# Altium schematic sheet MCU_Power_Sheet.SchDoc
size A4
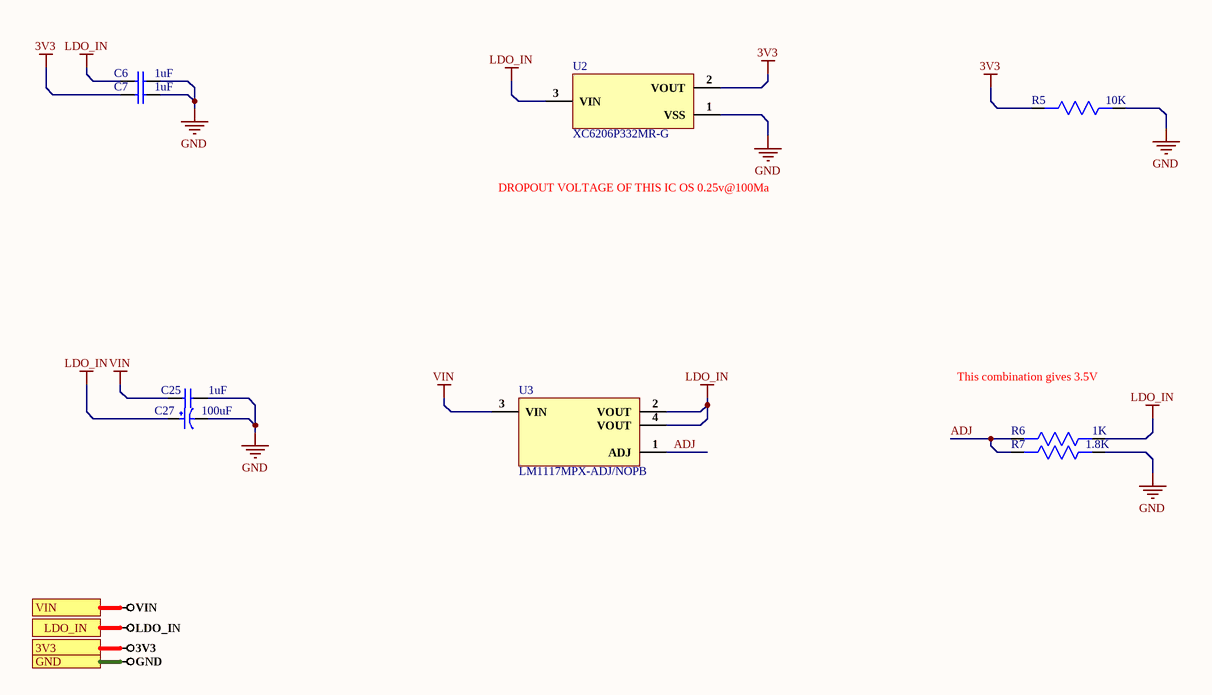
[diagram p0: MCU_Power_Sheet.SchDoc]

## Parts
C6  1uF  [Cap0603]
C7  1uF  [Cap0603]
C25  1uF  [Cap0603]
C27  100uF  [RVT1A101M0505]
R5  10K  [RES 0805]
R6  1K  [RES 0805]
R7  1.8K  [Res0603]
U2  XC6206P332MR-G  [sot-23]
U3  LM1117MPX-ADJ/NOPB  [SOT-223]

## Ports
3V3, GND, LDO_IN, VIN

## Nets
3V3: C7.1 R5.2 U2.2(VOUT) ; port 3V3
GND: C6.2 C7.2 C25.2 C27.2 R5.1 R7.1 U2.1(VSS) ; port GND
LDO_IN: C6.1 C27.1 R6.1 U2.3(VIN) U3.2(VOUT) U3.4(VOUT) ; port LDO_IN
VIN: C25.1 U3.3(VIN) ; port VIN
ADJ: R6.2 R7.2 U3.1(ADJ)

## Notes on the sheet
- DROPOUT VOLTAGE OF THIS IC OS 0.25v@100Ma
- This combination gives 3.5V

## Library data of the parts
C6 C7 C25 = CC0603KRX5R8BB105: CAP CER 1UF 25V X5R 0603; Manufacturer: Yageo; Tolerance: 10%; Supplier 1: Digi-Key; Manufacturer Part Number: CC0603KRX5R8BB105; RoHS: Yes; Category: Ceramic Capacitors; Stock 1: 919939; Pricing 1: 1=0.12000, 10=0.08400, 50=0.04760, 100=0.03940, 500=0.02764, 1000=0.02288 (USD); Mount: Surface Mount; Case/Package: 0603; Number of Pins: 2; Case Code (Metric): 1608; Case Code (Imperial): 0603; Min Operating Temperature: -55°C; Max Operating Temperature: 85°C; Capacitance: 1uF; Dielectric: X5R; Package Quantity: 1; Voltage Rating: 25V; Packaging: Tape and Reel; Termination: SMD/SMT; Voltage Rating (DC): 25V; Series: CC; Construction: Flat; Length: 1.6mm; Width: 0.031inch; Height: 0.8mm; Thickness: 0.035inch; Depth: 0.8mm; Radiation Hardening: No; REACH SVHC: No SVHC; Lead Free: Lead Free; Halogen Free: Halogen Free; RoHS Compliant: Yes; ComponentLink1URL: https://datasheet.ciiva.com/176/mlccorderingcode-176785.pdf?src-supplier=Digi-Key; ComponentLink1Description: https://datasheet.ciiva.com/176/mlccorderingcode-176785.pdf?src-supplier=Digi-Key; ComponentLink2URL: https://datasheet.ciiva.com/176/mlccorderingcode-176786.pdf?src-supplier=Digi-Key; ComponentLink2Description: https://datasheet.ciiva.com/176/mlccorderingcode-176786.pdf?src-supplier=Digi-Key; ComponentLink3URL: https://datasheet.ciiva.com/176/mlccorderingcode-176787.pdf?src-supplier=Digi-Key; ComponentLink3Description: https://datasheet.ciiva.com/176/mlccorderingcode-176787.pdf?src-supplier=Digi-Key; ComponentLink4URL: https://datasheet.ciiva.com/17436/upy-gphc-x5r-4v-to-50v-12-17436952.pdf?src-supplier=Avnet+Europe; ComponentLink4Description: https://datasheet.ciiva.com/17436/upy-gphc-x5r-4v-to-50v-12-17436952.pdf?src-supplier=Avnet+Europe; ComponentLink5URL: https://datasheet.ciiva.com/7978/1525783-7978171.pdf?src-supplier=Element14; ComponentLink5Description: https://datasheet.ciiva.com/7978/1525783-7978171.pdf?src-supplier=Element14; ComponentLink6URL: https://datasheet.ciiva.com/11586/upy-gphc-x5r-4v-to-50v-12-11586318.pdf?src-supplier=Avnet; ComponentLink6Description: https://datasheet.ciiva.com/11586/upy-gphc-x5r-4v-to-50v-12-11586318.pdf?src-supplier=Avnet; Supplier Part Number 1: 311-1445-1-ND
C27 = RVT1A101M0505: 100uF ±20% 10V 5mm 5.4mm 2000hrs 105℃ -45℃~+105℃ SMD,5x5.4mm Aluminum Electrolytic Capacitors - SMD RoHS; Manufacturer: CX(Dongguan Chengxing Elec); Package: SMD,5x5.4mm; Capacitance: 100uF; Tolerance: ±20%; Rated Voltage: 10V; φD: 5mm; L: 5.4mm; Operating Temperature: -45℃~+105℃
R5 = RMCF0805FT10K0: RES 10K OHM 1% 1/8W 0805; Manufacturer: Stackpole Electronics; Resistance: 10kR; Power Rating: 125mW; Temperature Coefficient: 100ppm/°C; Supplier 1: Digi-Key; Manufacturer Part Number: RMCF0805FT10K0; RoHS: Yes; Category: Chip SMD Resistors; Stock 1: 308321; Pricing 1: 1=0.10000, 10=0.02700, 100=0.01090, 1000=0.00488, 2500=0.00423 (USD); Mount: Surface Mount; Case/Package: 0805; Case Code (Metric): 2012; Case Code (Imperial): 0805; Contact Plating: Tin,Matte; Size Code: 0805; Min Operating Temperature: -55°C; Max Operating Temperature: 155°C; Tolerance: 1%; Packaging: Tape and Reel; Resistor Type: Thick Film; Number of Terminations: 2; Max Power Dissipation: 125mW; Features: Automotive AEC-Q200; Series: RMCF; Construction: Rectangular; Length: 2mm; Width: 0.049inch; Height: 0.026inch; Depth: 1.25mm; Radiation Hardening: No; Lead Free: Lead Free; Military Standard: Not; RoHS Compliant: Yes; ComponentLink1URL: https://datasheet.ciiva.com/15193/getdatasheetpartid-362046-15193525.pdf?src-supplier=Verical; ComponentLink1Description: https://datasheet.ciiva.com/15193/getdatasheetpartid-362046-15193525.pdf?src-supplier=Verical; Supplier Part Number 1: RMCF0805FT10K0CT-ND
R6 = CRCW08051K00JNEB: RES SMD 1K OHM 5% 1/8W 0805; Manufacturer: Vishay Dale; Resistance: 1kR; Power Rating: 125mW; Voltage Rating: 150V; Temperature Coefficient: 200ppm/°C; Supplier 1: Digi-Key; Manufacturer Part Number: CRCW08051K00JNEB; RoHS: Yes; Category: Chip SMD Resistors; Stock 1: 4389; Pricing 1: 1=0.10000, 10=0.05000, 100=0.02040, 1000=0.00914, 2500=0.00794, 5000=0.00656 (USD); Case/Package: 0805; Number of Pins: 2; Weight: 0.000194oz; Case Code (Imperial): 0805; Case Code (Metric): 2012; Contact Plating: Tin; Min Operating Temperature: -55°C; Max Operating Temperature: 155°C; Packaging: Tape and Reel; Tolerance: 5%; Package Quantity: 10000; Resistor Type: Thick Film; Number of Terminations: 2; Termination: SMD/SMT; Max Power Dissipation: 125mW; Voltage Rating (DC): 150V; Features: Automotive AEC-Q200; Length: 0.079inch; Width: 0.049inch; Height: 0.02inch; Radiation Hardening: No; REACH SVHC: Unknown; Lead Free: Lead Free; ComponentLink1URL: https://datasheet.ciiva.com/5548/dcrcwe3-109170-5548326.pdf?src-supplier=Mouser; ComponentLink1Description: https://datasheet.ciiva.com/5548/dcrcwe3-109170-5548326.pdf?src-supplier=Mouser; ComponentLink2URL: https://datasheet.ciiva.com/28621/1747939-28621434.pdf?src-supplier=Element14; ComponentLink2Description: https://datasheet.ciiva.com/28621/1747939-28621434.pdf?src-supplier=Element14; Supplier Part Number 1: 541-CRCW08051K00JNEBCT-ND
R7 = RC0603FR-071K8L: Res Thick Film 0603 1.8K Ohm 1% 0.1W(1/10W) ±100ppm/C Molded SMD Paper T/R; Manufacturer: Yageo; Resistance: 1.8kR; Temperature Coefficient: 100ppm/°C; Voltage Rating (DC): 50V; Power Rating: 100mW; Supplier 1: Digi-Key; Manufacturer Part Number: RC0603FR-071K8L; RoHS: Yes; Category: Chip SMD Resistors; Stock 1: 827154; Pricing 1: 1=0.10000, 10=0.02400, 100=0.00970, 1000=0.00436, 2500=0.00378 (USD); Case/Package: 0603; Number of Pins: 2; Case Code (Metric): 1608; Case Code (Imperial): 0603; Size Code: 0603; Min Operating Temperature: -55°C; Max Operating Temperature: 155°C; Tolerance: 1%; Resistor Type: Thick Film; Packaging: Tape and Reel; Voltage Rating: 50V; Package Quantity: 5000; Number of Terminations: 2; Termination: SMD/SMT; Max Power Dissipation: 100mW; Features: Moisture Resistant; Series: RC; Resistance Tolerance: 1%; Technology: THICK FILM; Construction: Rectangular; Length: 1.6mm; Width: 0.8mm; Height: 0.45mm; Depth: 0.8mm; REACH SVHC: No SVHC; Lead Free: Lead Free; Military Standard: Not; RoHS Compliant: Yes; ComponentLink1URL: https://datasheet.ciiva.com/11808/0900766b80f96399-11808105.pdf?src-supplier=RSComponents; ComponentLink1Description: https://datasheet.ciiva.com/11808/0900766b80f96399-11808105.pdf?src-supplier=RSComponents; ComponentLink2URL: https://datasheet.ciiva.com/2519/pyu-r-int-thick-7-2519189.pdf?src-supplier=Digi-Key; ComponentLink2Description: https://datasheet.ciiva.com/2519/pyu-r-int-thick-7-2519189.pdf?src-supplier=Digi-Key; ComponentLink3URL: https://datasheet.ciiva.com/7746/443971-7746277.pdf?src-supplier=Element14; ComponentLink3Description: https://datasheet.ciiva.com/7746/443971-7746277.pdf?src-supplier=Element14; ComponentLink4URL: https://datasheet.ciiva.com/2519/pyu-r-int-thick-7-2519190.pdf?src-supplier=Digi-Key; ComponentLink4Description: https://datasheet.ciiva.com/2519/pyu-r-int-thick-7-2519190.pdf?src-supplier=Digi-Key; ComponentLink5URL: https://datasheet.ciiva.com/7746/443971-7746278.pdf?src-supplier=Element14; ComponentLink5Description: https://datasheet.ciiva.com/7746/443971-7746278.pdf?src-supplier=Element14; ComponentLink6URL: https://datasheet.ciiva.com/12558/rc0603-272842-12558694.pdf?src-supplier=Mouser; ComponentLink6Description: https://datasheet.ciiva.com/12558/rc0603-272842-12558694.pdf?src-supplier=Mouser; ComponentLink7URL: https://datasheet.ciiva.com/2519/pyu-r-int-thick-7-2519191.pdf?src-supplier=Digi-Key; ComponentLink7Description: https://datasheet.ciiva.com/2519/pyu-r-int-thick-7-2519191.pdf?src-supplier=Digi-Key; Supplier Part Number 1: 311-1.80KHRCT-ND
U2 = XC6206P332MR-G: IC REG LINEAR 3.3V 200MA SOT23; Manufacturer: Torex; Output Type: Fixed; Output Configuration: Positive; Number of Regulators: 1; Max Input Voltage: 6V; Dropout Voltage: 680mV; Quiescent Current: 3uA; Supplier 1: Avnet; Manufacturer Part Number: XC6206P332MR-G; RoHS: Yes; Category: Voltage Regulators - Linear; Pricing 1: 3000=0.23146, 6000=0.22820, 12000=0.22168, 18000=0.21679, 24000=0.20864, 30000=0.20375, 300000=0.19886 (USD); Mount: Surface Mount; Case/Package: TO-236-3; Min Operating Temperature: -40°C; Max Operating Temperature: 85°C; Min Output Voltage: 3.3V; Output Current: 200mA; Max Supply Current: 3uA; RoHS Compliant: Yes; ComponentLink1URL: https://www.torexsemi.com/file/xc6206/XC6206.pdf?src-supplier=Digi-Key; ComponentLink1Description: https://www.torexsemi.com/file/xc6206/XC6206.pdf?src-supplier=Digi-Key; Supplier Part Number 1: XC6206P332MR-G
U3 = LM1117MPX-ADJ/NOPB: PMIC - LDO voltage regulator Texas Instruments LM1117MPX-ADJ/NOPB Positivbe, adjustable SOT 223; Manufacturer: TI National Semiconductor; Max Input Voltage: 15V; Output Voltage: 13.8V; Number of Outputs: 1; Max Output Current: 800mA; Reference Voltage: 1.262V; Polarity: Positive; Accuracy: 1%; Dropout Voltage: 1.2V; Min Input Voltage: 2.6V; Min Output Voltage: 1.25V; Quiescent Current: 5mA; Max Supply Current: 10mA; Power Supply Rejection Ratio (PSRR): 75dB; Supplier 1: Mouser; Manufacturer Part Number: LM1117MPX-ADJ/NOPB; RoHS: Yes; Category: Voltage Regulators - Linear; Stock 1: 273; Pricing 1: 1=1.28000, 10=1.15000, 50=1.09000, 100=0.89500, 1000=0.58400, 10000=0.53200 (USD); Mount: Surface Mount; Case/Package: SOT-223; Number of Pins: 4; Contact Plating: Tin,Matte; Min Operating Temperature: 0°C; Max Operating Temperature: 125°C; Output Type: Adjustable; Current Rating: 800mA; Packaging: Tape and Reel; Package Quantity: 2000; Output Current: 800mA; Number of Regulators: 1; Min Current Limit: 800mA; Max Output Voltage: 13.8V; Output Voltage Accuracy: 1%; Series: -; Output Configuration: Positive; Radiation Hardening: No; REACH SVHC: No SVHC; Lead Free: Lead Free; ComponentLink1URL: https://datasheet.ciiva.com/15111/getdatasheetpartid-55626-15111244.pdf?src-supplier=Verical; ComponentLink1Description: https://datasheet.ciiva.com/15111/getdatasheetpartid-55626-15111244.pdf?src-supplier=Verical; ComponentLink2URL: https://datasheet.ciiva.com/3223/lm1117-n-3223530.pdf?src-supplier=Avnet; ComponentLink2Description: https://datasheet.ciiva.com/3223/lm1117-n-3223530.pdf?src-supplier=Avnet; ComponentLink3URL: https://datasheet.ciiva.com/3223/lm1117-n-3223531.pdf?src-supplier=Avnet; ComponentLink3Description: https://datasheet.ciiva.com/3223/lm1117-n-3223531.pdf?src-supplier=Avnet; ComponentLink4URL: https://datasheet.ciiva.com/6596/lm1117-n-6596777.pdf?src-supplier=Digi-Key; ComponentLink4Description: https://datasheet.ciiva.com/6596/lm1117-n-6596777.pdf?src-supplier=Digi-Key; ComponentLink5URL: https://datasheet.ciiva.com/6596/lm1117-n-6596778.pdf?src-supplier=Digi-Key; ComponentLink5Description: https://datasheet.ciiva.com/6596/lm1117-n-6596778.pdf?src-supplier=Digi-Key; ComponentLink6URL: https://datasheet.ciiva.com/6596/lm1117-n-6596779.pdf?src-supplier=Digi-Key; ComponentLink6Description: https://datasheet.ciiva.com/6596/lm1117-n-6596779.pdf?src-supplier=Digi-Key; ComponentLink7URL: https://datasheet.ciiva.com/25980/lm1117-n-25980333.pdf?src-supplier=Avnet+Europe; ComponentLink7Description: https://datasheet.ciiva.com/25980/lm1117-n-25980333.pdf?src-supplier=Avnet+Europe; ComponentLink8URL: https://datasheet.ciiva.com/22710/lm1117-n-22710935.pdf?src-supplier=Element14; ComponentLink8Description: https://datasheet.ciiva.com/22710/lm1117-n-22710935.pdf?src-supplier=Element14; Supplier Part Number 1: 926-LM1117MPXADJNOPB